# Altium project PCB_Project.PrjPcb
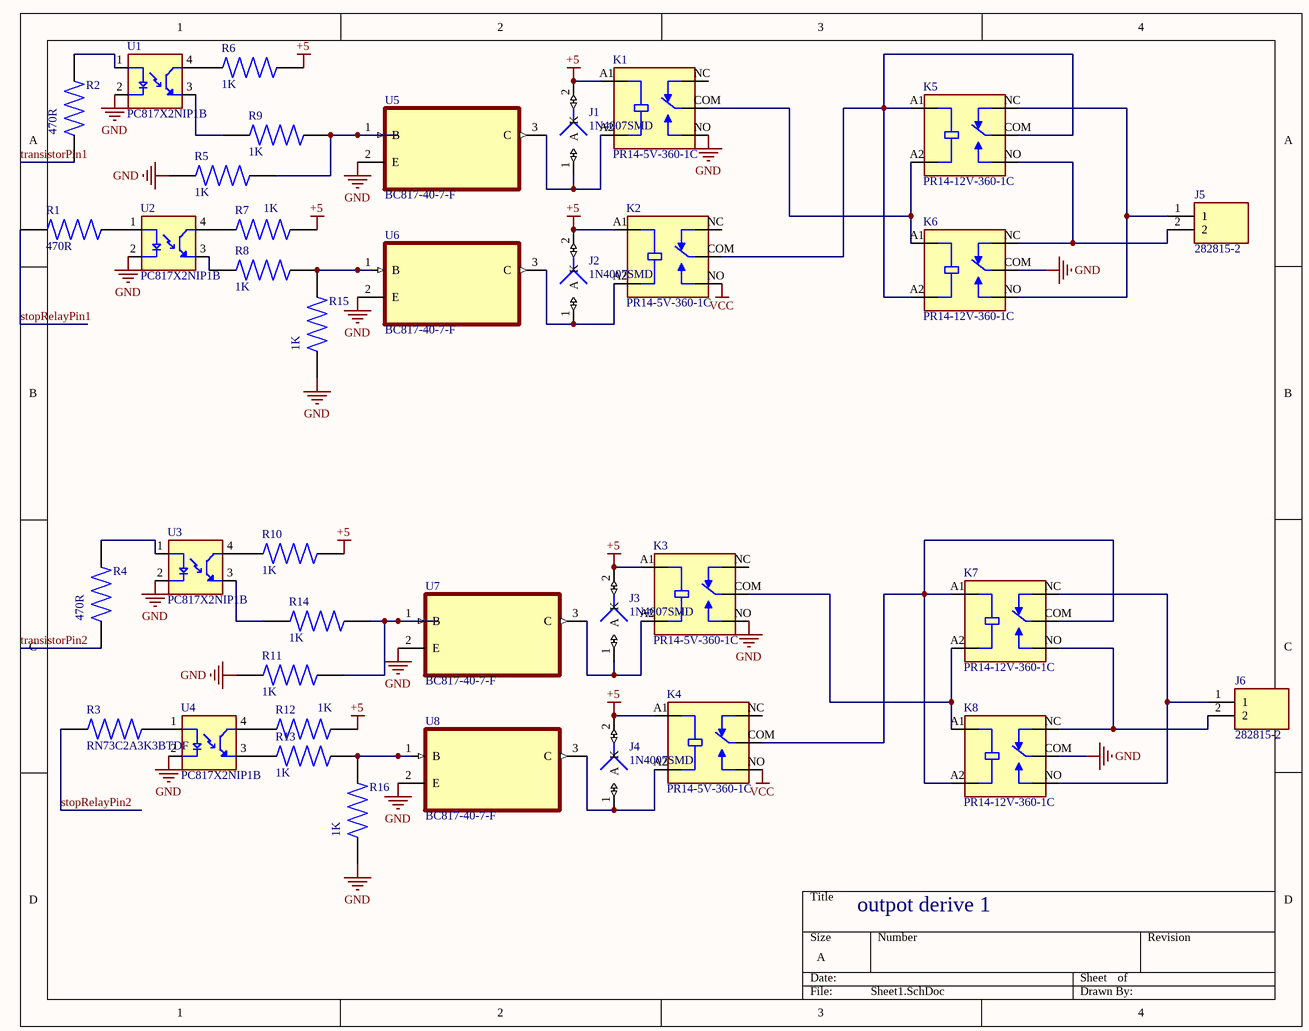
[diagram p0: Sheet1.SchDoc]
7 sheets, 153 parts. Net scope: global (net labels, ports and power ports of the same name join across sheets).
Board file: PCB1.PcbDoc
Sheets:
  Sheet1.SchDoc
  Sheet2.SchDoc
  Sheet3.SchDoc
  Sheet4.SchDoc
  Sheet5.SchDoc
  Sheet6.SchDoc
  Sheet7.SchDoc

## Sheet Sheet1.SchDoc
size A; SheetNumber: 1; SheetTotal: 7

### Parts
J1  1N4007SMD  [C1206]
J2  1N4007SMD  [C1206]
J3  1N4007SMD  [C1206]
J4  1N4007SMD  [C1206]
J5  282815-2  [TE_282815-2]
J6  282815-2  [TE_282815-2]
K1  PR14-5V-360-1C  [RELAY_PR14-5V-360-1C]
K2  PR14-5V-360-1C  [RELAY_PR14-5V-360-1C]
K3  PR14-5V-360-1C  [RELAY_PR14-5V-360-1C]
K4  PR14-5V-360-1C  [RELAY_PR14-5V-360-1C]
K5  PR14-12V-360-1C  [RELAY_PR14-5V-360-1C]
K6  PR14-12V-360-1C  [RELAY_PR14-5V-360-1C]
K7  PR14-12V-360-1C  [RELAY_PR14-5V-360-1C]
K8  PR14-12V-360-1C  [RELAY_PR14-5V-360-1C]
R1  470R  [RESC2012X65N]
R2  470R  [RESC2012X65N]
R3  RN73C2A3K3BTDF  [RESC2012X65N]
R4  470R  [RESC2012X65N]
R5  1K  [RESC2012X65N]
R6  1K  [RESC2012X65N]
R7  1K  [RESC2012X65N]
R8  1K  [RESC2012X65N]
R9  1K  [RESC2012X65N]
R10  1K  [RESC2012X65N]
R11  1K  [RESC2012X65N]
R12  1K  [RESC2012X65N]
R13  1K  [RESC2012X65N]
R14  1K  [RESC2012X65N]
R15  1K  [RESC2012X65N]
R16  1K  [RESC2012X65N]
U1  PC817X2NIP1B  [SOIC254P960X420-4N]
U2  PC817X2NIP1B  [SOIC254P960X420-4N]
U3  PC817X2NIP1B  [SOIC254P960X420-4N]
U4  PC817X2NIP1B  [SOIC254P960X420-4N]
U5  BC817-40-7-F  [SOT103P240X110-3N]
U6  BC817-40-7-F  [SOT103P240X110-3N]
U7  BC817-40-7-F  [SOT103P240X110-3N]
U8  BC817-40-7-F  [SOT103P240X110-3N]

### Nets
+5: J1.2(K) J2.2(K) J3.2(K) J4.2(K) K1.A1(COIL1) K2.A1(COIL1) K3.A1(COIL1) K4.A1(COIL1) R6.2 R7.2 R10.2 R12.2
GND: K1.NO K3.NO K6.COM K8.COM R5.1 R11.1 R15.1 R16.1 U1.2(C) U2.2(C) U3.2(C) U4.2(C) U5.2(E) U6.2(E) U7.2(E) U8.2(E)
VCC: K2.NO K4.NO
stopRelayPin1: R1.1
stopRelayPin2: R3.1
transistorPin1: R2.1
transistorPin2: R4.1
NetJ1_1: J1.1(A) K1.A2(COIL2) U5.3(C)
NetJ2_1: J2.1(A) K2.A2(COIL2) U6.3(C)
NetJ3_1: J3.1(A) K3.A2(COIL2) U7.3(C)
NetJ4_1: J4.1(A) K4.A2(COIL2) U8.3(C)
NetJ5_1: J5.1 K5.NC K6.NO
NetJ5_2: J5.2 K5.NO K6.NC
NetJ6_1: J6.1 K7.NC K8.NO
NetJ6_2: J6.2 K7.NO K8.NC
NetK1_COM: K1.COM K5.A2(COIL2) K6.A1(COIL1)
NetK2_COM: K2.COM K5.A1(COIL1) K5.COM K6.A2(COIL2)
NetK3_COM: K3.COM K7.A2(COIL2) K8.A1(COIL1)
NetK4_COM: K4.COM K7.A1(COIL1) K7.COM K8.A2(COIL2)
NetR1_2: R1.2 U2.1(A)
NetR2_2: R2.2 U1.1(A)
NetR3_2: R3.2 U4.1(A)
NetR4_2: R4.2 U3.1(A)
NetR5_2: R5.2 R9.2 U5.1(B)
NetR6_1: R6.1 U1.4(CT)
NetR7_1: R7.1 U2.4(CT)
NetR8_1: R8.1 U2.3(ET)
NetR8_2: R8.2 R15.2 U6.1(B)
NetR9_1: R9.1 U1.3(ET)
NetR10_1: R10.1 U3.4(CT)
NetR11_2: R11.2 R14.2 U7.1(B)
NetR12_1: R12.1 U4.4(CT)
NetR13_1: R13.1 U4.3(ET)
NetR13_2: R13.2 R16.2 U8.1(B)
NetR14_1: R14.1 U3.3(ET)

Not connected (* = marked no-connect by the designer): K1 NC; K2 NC; K3 NC; K4 NC

### Notes on the sheet
- outpot derive 1

### Library data of the parts
J1-J4 = 1N4007SMD: RECTIFIER, 1KV, 1A, DO-214AC; Available until stocks are exhausted Alternatives available; MF: Multicomp Pro; Availability: Not in stock; Check_prices: https://www.snapeda.com/parts/1N4007SMD/Multicomp/view-part/?ref=eda; Package: None; SnapEDA_Link: https://www.snapeda.com/parts/1N4007SMD/Multicomp/view-part/?ref=snap; MP: 1N4007SMD; Price: None; Value: *
J5 J6 = 282815-2: 2 Position Terminal Block Header, Male Pins, Shrouded (2 Side) 0.200 (5.08mm) 90Â°, Right Angle - Through Hole; MF: TE Connectivity; SnapEDA_Link: https://www.snapeda.com/parts/282815-2/TE+Connectivity+AMP+Connectors/view-part/?ref=snap; Package: None; Value: *; MP: 282815-2; EU_RoHS_Compliance: Compliant with Exemptions; Check_prices: https://www.snapeda.com/parts/282815-2/TE+Connectivity+AMP+Connectors/view-part/?ref=eda
K1-K8 = PR14-5V-360-1C: 19 x 15.5 x 15.8 mm, 5 V, 10 A, SPDT (1 Form C), Power Relay; MF: Same Sky; SnapEDA_Link: https://www.snapeda.com/parts/PR14-5V-360-1C/Same+Sky/view-part/?ref=snap; Package: None; Value: *; MP: PR14-5V-360-1C; Check_prices: https://www.snapeda.com/parts/PR14-5V-360-1C/Same+Sky/view-part/?ref=eda
R1-R16 = RN73C2A3K3BTDF: TE; IND Devices; Resistors; RN 0805 3K3 0.1% 10PPM 1K RL | TE Connectivity RN73C2A3K3BTDF; Power_Rating: .1 W; Resistance: 3.3K; Voltage_Rating: 100 V; Tolerance: .1%; SnapEDA_Link: https://www.snapeda.com/parts/RN73C2A3K3BTDF/TE+Connectivity/view-part/?ref=snap; Package: 0805; Value: *; MF: TE Connectivity; MP: RN73C2A3K3BTDF; EU_RoHS_Compliance: Compliant; Check_prices: https://www.snapeda.com/parts/RN73C2A3K3BTDF/TE+Connectivity/view-part/?ref=eda
U1-U4 = PC817X2NIP1B: Optocoupler DC-IN 1-CH Transistor DC-OUT 4-Pin DIP SMD T/R; MF: Sharp Microelectronics; SnapEDA_Link: https://www.snapeda.com/parts/PC817X2NIP1B/Sharp+Microelectronics/view-part/?ref=snap; Package: SMD-4 Sharp Microelectronics; Value: *; MP: PC817X2NIP1B; Check_prices: https://www.snapeda.com/parts/PC817X2NIP1B/Sharp+Microelectronics/view-part/?ref=eda
U5-U8 = BC817-40-7-F: Bipolar (BJT) Transistor NPN 45 V 500 mA 100MHz 310 mW Surface Mount SOT-23-3; MF: Diodes Inc.; MP: BC817-40-7-F; Price: None; Package: SOT-23 Diodes Inc.; Check_prices: https://www.snapeda.com/parts/BC817-40-7-F/Diodes+Inc./view-part/?ref=eda; Value: *; Availability: In Stock; Purchase-URL: https://pricing.snapeda.com/search/part/BC817-40-7-F/?ref=eda; SnapEDA_Link: https://www.snapeda.com/parts/BC817-40-7-F/Diodes+Inc./view-part/?ref=snap

## Sheet Sheet2.SchDoc
size A; SheetNumber: 2; SheetTotal: 7
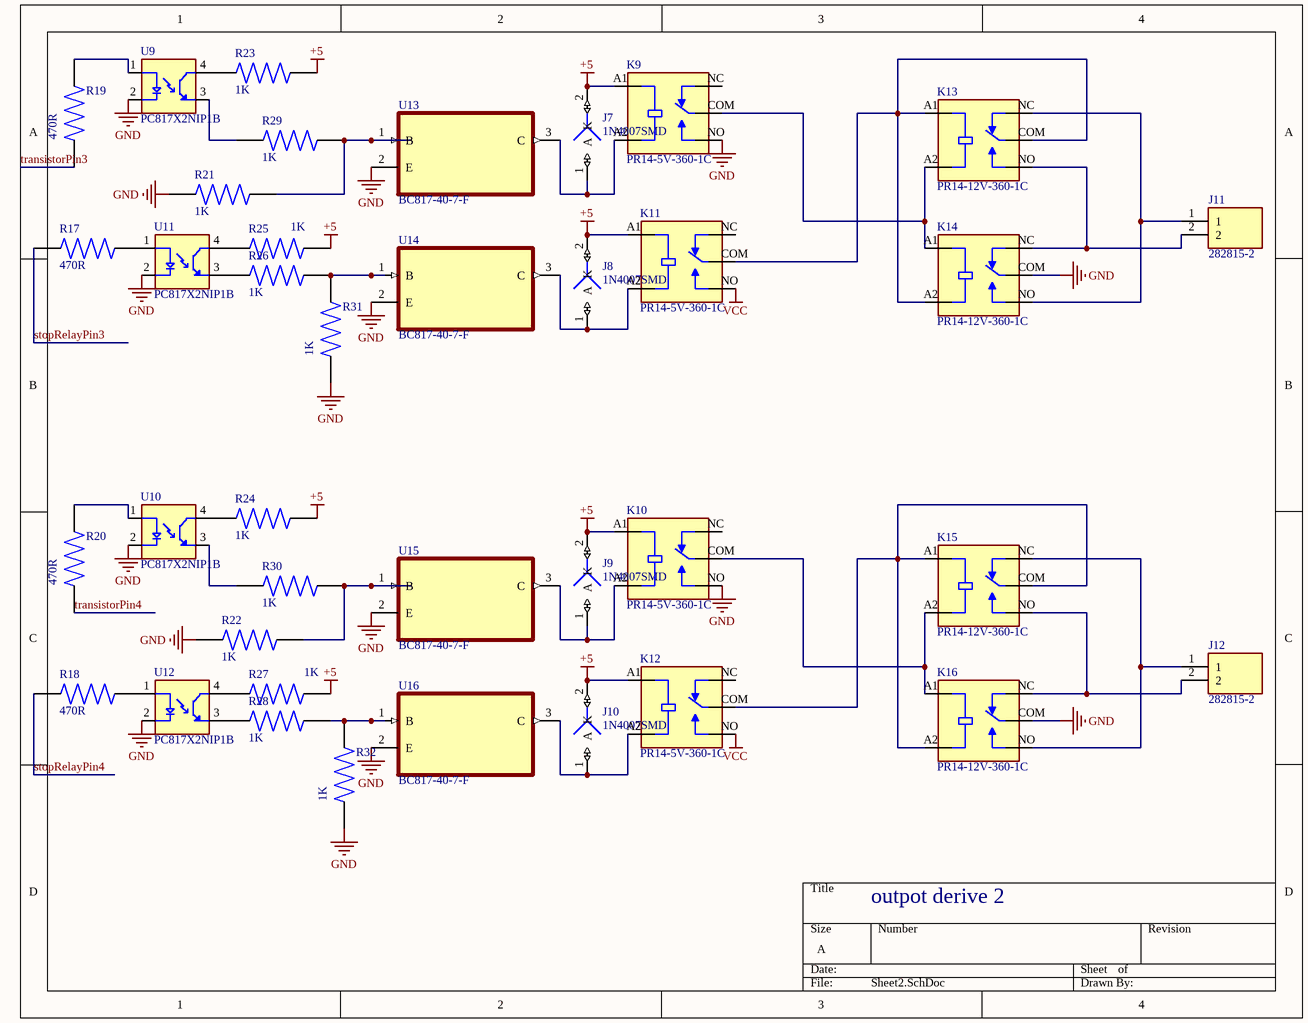
[diagram p1: Sheet2.SchDoc]

### Parts
J7  1N4007SMD  [C1206]
J8  1N4007SMD  [C1206]
J9  1N4007SMD  [C1206]
J10  1N4007SMD  [C1206]
J11  282815-2  [TE_282815-2]
J12  282815-2  [TE_282815-2]
K9  PR14-5V-360-1C  [RELAY_PR14-5V-360-1C]
K10  PR14-5V-360-1C  [RELAY_PR14-5V-360-1C]
K11  PR14-5V-360-1C  [RELAY_PR14-5V-360-1C]
K12  PR14-5V-360-1C  [RELAY_PR14-5V-360-1C]
K13  PR14-12V-360-1C  [RELAY_PR14-5V-360-1C]
K14  PR14-12V-360-1C  [RELAY_PR14-5V-360-1C]
K15  PR14-12V-360-1C  [RELAY_PR14-5V-360-1C]
K16  PR14-12V-360-1C  [RELAY_PR14-5V-360-1C]
R17  470R  [RESC2012X65N]
R18  470R  [RESC2012X65N]
R19  470R  [RESC2012X65N]
R20  470R  [RESC2012X65N]
R21  1K  [RESC2012X65N]
R22  1K  [RESC2012X65N]
R23  1K  [RESC2012X65N]
R24  1K  [RESC2012X65N]
R25  1K  [RESC2012X65N]
R26  1K  [RESC2012X65N]
R27  1K  [RESC2012X65N]
R28  1K  [RESC2012X65N]
R29  1K  [RESC2012X65N]
R30  1K  [RESC2012X65N]
R31  1K  [RESC2012X65N]
R32  1K  [RESC2012X65N]
U9  PC817X2NIP1B  [SOIC254P960X420-4N]
U10  PC817X2NIP1B  [SOIC254P960X420-4N]
U11  PC817X2NIP1B  [SOIC254P960X420-4N]
U12  PC817X2NIP1B  [SOIC254P960X420-4N]
U13  BC817-40-7-F  [SOT103P240X110-3N]
U14  BC817-40-7-F  [SOT103P240X110-3N]
U15  BC817-40-7-F  [SOT103P240X110-3N]
U16  BC817-40-7-F  [SOT103P240X110-3N]

### Nets
+5: J7.2(K) J8.2(K) J9.2(K) J10.2(K) K9.A1(COIL1) K10.A1(COIL1) K11.A1(COIL1) K12.A1(COIL1) R23.2 R24.2 R25.2 R27.2
GND: K9.NO K10.NO K14.COM K16.COM R21.1 R22.1 R31.1 R32.1 U9.2(C) U10.2(C) U11.2(C) U12.2(C) U13.2(E) U14.2(E) U15.2(E) U16.2(E)
VCC: K11.NO K12.NO
stopRelayPin3: R17.1
stopRelayPin4: R18.1
transistorPin3: R19.1
transistorPin4: R20.1
NetJ7_1: J7.1(A) K9.A2(COIL2) U13.3(C)
NetJ8_1: J8.1(A) K11.A2(COIL2) U14.3(C)
NetJ9_1: J9.1(A) K10.A2(COIL2) U15.3(C)
NetJ10_1: J10.1(A) K12.A2(COIL2) U16.3(C)
NetJ11_1: J11.1 K13.NC K14.NO
NetJ11_2: J11.2 K13.NO K14.NC
NetJ12_1: J12.1 K15.NC K16.NO
NetJ12_2: J12.2 K15.NO K16.NC
NetK9_COM: K9.COM K13.A2(COIL2) K14.A1(COIL1)
NetK10_COM: K10.COM K15.A2(COIL2) K16.A1(COIL1)
NetK11_COM: K11.COM K13.A1(COIL1) K13.COM K14.A2(COIL2)
NetK12_COM: K12.COM K15.A1(COIL1) K15.COM K16.A2(COIL2)
NetR17_2: R17.2 U11.1(A)
NetR18_2: R18.2 U12.1(A)
NetR19_2: R19.2 U9.1(A)
NetR20_2: R20.2 U10.1(A)
NetR21_2: R21.2 R29.2 U13.1(B)
NetR22_2: R22.2 R30.2 U15.1(B)
NetR23_1: R23.1 U9.4(CT)
NetR24_1: R24.1 U10.4(CT)
NetR25_1: R25.1 U11.4(CT)
NetR26_1: R26.1 U11.3(ET)
NetR26_2: R26.2 R31.2 U14.1(B)
NetR27_1: R27.1 U12.4(CT)
NetR28_1: R28.1 U12.3(ET)
NetR28_2: R28.2 R32.2 U16.1(B)
NetR29_1: R29.1 U9.3(ET)
NetR30_1: R30.1 U10.3(ET)

Not connected (* = marked no-connect by the designer): K9 NC; K10 NC; K11 NC; K12 NC

### Notes on the sheet
- outpot derive 2

### Library data of the parts
J7-J10 = 1N4007SMD: as J1 on sheet Sheet1; Availability: Not in stock; Check_prices: https://www.snapeda.com/parts/1N4007SMD/Multicomp/view-part/?ref=eda; Package: None; SnapEDA_Link: https://www.snapeda.com/parts/1N4007SMD/Multicomp/view-part/?ref=snap; MP: 1N4007SMD; Price: None; Value: *
J11 J12 = 282815-2: as J5 on sheet Sheet1; SnapEDA_Link: https://www.snapeda.com/parts/282815-2/TE+Connectivity+AMP+Connectors/view-part/?ref=snap; Package: None; Value: *; MP: 282815-2; EU_RoHS_Compliance: Compliant with Exemptions; Check_prices: https://www.snapeda.com/parts/282815-2/TE+Connectivity+AMP+Connectors/view-part/?ref=eda
K9-K16 = PR14-5V-360-1C: as K1 on sheet Sheet1; SnapEDA_Link: https://www.snapeda.com/parts/PR14-5V-360-1C/Same+Sky/view-part/?ref=snap; Package: None; Value: *; MP: PR14-5V-360-1C; Check_prices: https://www.snapeda.com/parts/PR14-5V-360-1C/Same+Sky/view-part/?ref=eda
R17-R32 = RN73C2A3K3BTDF: as R1 on sheet Sheet1; SnapEDA_Link: https://www.snapeda.com/parts/RN73C2A3K3BTDF/TE+Connectivity/view-part/?ref=snap; Package: 0805; Value: *; MF: TE Connectivity; MP: RN73C2A3K3BTDF; EU_RoHS_Compliance: Compliant; Check_prices: https://www.snapeda.com/parts/RN73C2A3K3BTDF/TE+Connectivity/view-part/?ref=eda
U9-U12 = PC817X2NIP1B: as U1 on sheet Sheet1; SnapEDA_Link: https://www.snapeda.com/parts/PC817X2NIP1B/Sharp+Microelectronics/view-part/?ref=snap; Package: SMD-4 Sharp Microelectronics; Value: *; MP: PC817X2NIP1B; Check_prices: https://www.snapeda.com/parts/PC817X2NIP1B/Sharp+Microelectronics/view-part/?ref=eda
U13-U16 = BC817-40-7-F: as U5 on sheet Sheet1; MP: BC817-40-7-F; Price: None; Package: SOT-23 Diodes Inc.; Check_prices: https://www.snapeda.com/parts/BC817-40-7-F/Diodes+Inc./view-part/?ref=eda; Value: *; Availability: In Stock; Purchase-URL: https://pricing.snapeda.com/search/part/BC817-40-7-F/?ref=eda; SnapEDA_Link: https://www.snapeda.com/parts/BC817-40-7-F/Diodes+Inc./view-part/?ref=snap

## Sheet Sheet3.SchDoc
size A; SheetNumber: 3; SheetTotal: 7
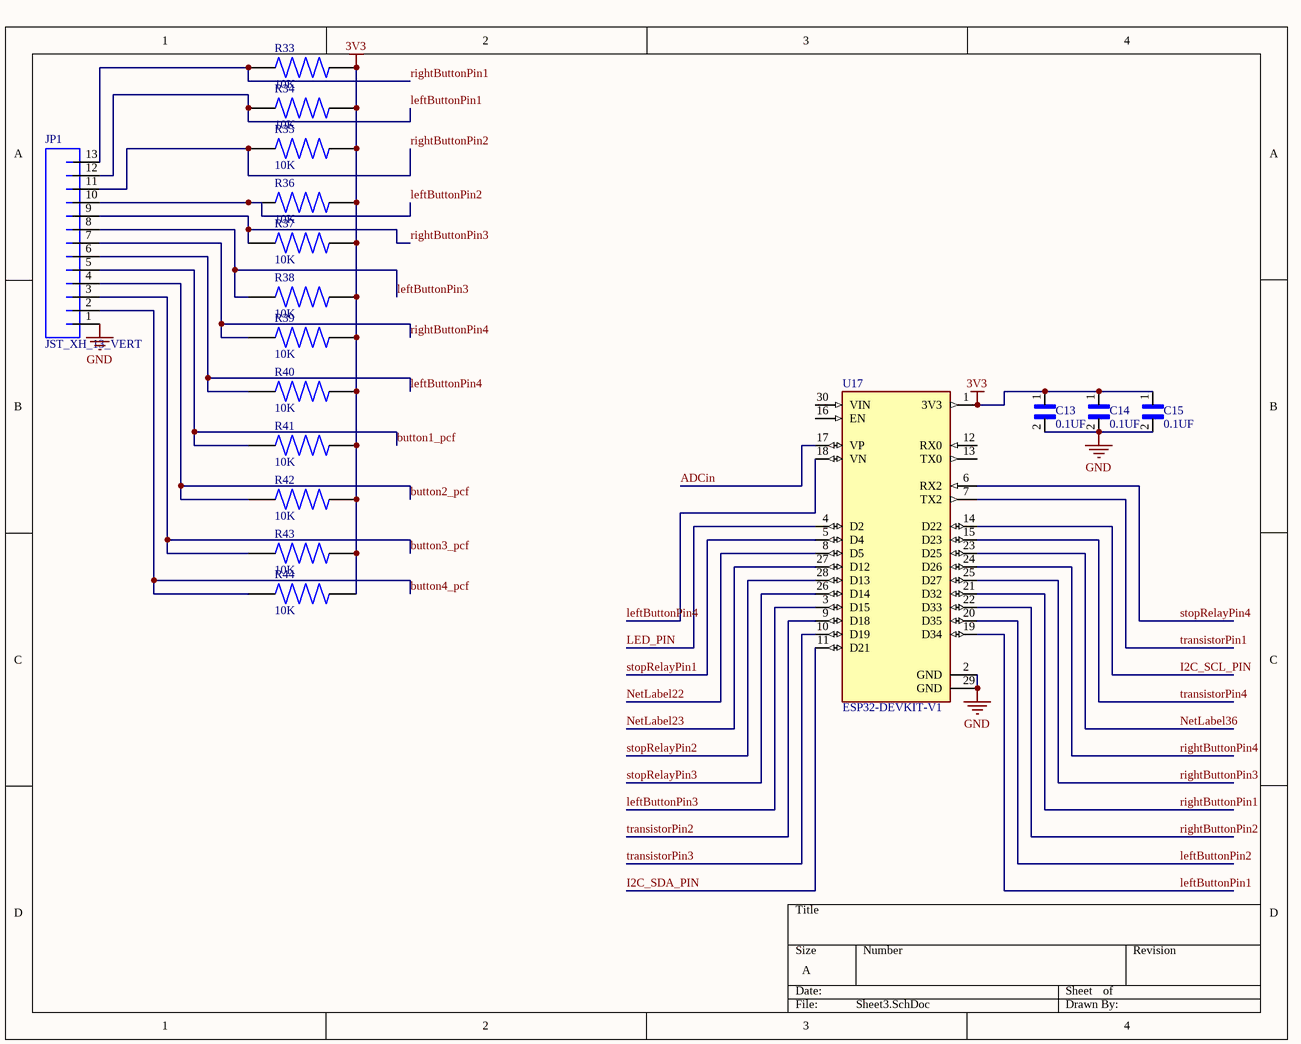
[diagram p2: Sheet3.SchDoc]

### Parts
C13  0.1UF  [CAPC2012X135N]
C14  0.1UF  [CAPC2012X135N]
C15  0.1UF  [CAPC2012X135N]
JP1  JST_XH_13_VERT  [JST-XH-13-PTH-VERT]
R33  10K  [RESC2012X65N]
R34  10K  [RESC2012X65N]
R35  10K  [RESC2012X65N]
R36  10K  [RESC2012X65N]
R37  10K  [RESC2012X65N]
R38  10K  [RESC2012X65N]
R39  10K  [RESC2012X65N]
R40  10K  [RESC2012X65N]
R41  10K  [RESC2012X65N]
R42  10K  [RESC2012X65N]
R43  10K  [RESC2012X65N]
R44  10K  [RESC2012X65N]
U17  ESP32-DEVKIT-V1  [MODULE_ESP32_DEVKIT_V1]

### Nets
3V3: C13.1 C14.1 C15.1 R33.2 R34.2 R35.2 R36.2 R37.2 R38.2 R39.2 R40.2 R41.2 R42.2 R43.2 R44.2 U17.1(3V3)
GND: C13.2 C14.2 C15.2 JP1.1 U17.2(GND) U17.29(GND)
ADCin: U17.17(VP)
button1_pcf: JP1.5 R41.1
button2_pcf: JP1.4 R42.1
button3_pcf: JP1.3 R43.1
button4_pcf: JP1.2 R44.1
I2C_SCL_PIN: U17.14(D22)
I2C_SDA_PIN: U17.11(D21)
LED_PIN: U17.4(D2)
leftButtonPin1: JP1.12 R34.1 U17.19(D34)
leftButtonPin2: JP1.10 R36.1 U17.20(D35)
leftButtonPin3: JP1.8 R38.1 U17.3(D15)
leftButtonPin4: JP1.6 R40.1 U17.18(VN)
NetLabel22: U17.8(D5)
NetLabel23: U17.27(D12)
NetLabel36: U17.23(D25)
rightButtonPin1: JP1.13 R33.1 U17.21(D32)
rightButtonPin2: JP1.11 R35.1 U17.22(D33)
rightButtonPin3: JP1.9 R37.1 U17.25(D27)
rightButtonPin4: JP1.7 R39.1 U17.24(D26)
stopRelayPin1: U17.5(D4)
stopRelayPin2: U17.28(D13)
stopRelayPin3: U17.26(D14)
stopRelayPin4: U17.6(RX2)
transistorPin1: U17.7(TX2)
transistorPin2: U17.9(D18)
transistorPin3: U17.10(D19)
transistorPin4: U17.15(D23)

Not connected (* = marked no-connect by the designer): U17 12(RX0) 13(TX0) 16(EN) 30(VIN)

### Library data of the parts
C13-C15 = GCM2165C2A151JA16D: Cap Ceramic 150pF 100V C0G 5% Pad SMD 0805 125Â°C Automotive T/R; Package: None; Price: None; Value: *; MP: GCM2165C2A151JA16D; Availability: Unavailable
JP1 = JST_XH_13_VERT: Manufacturer: JST Sales America, Inc.; PartNumber: B13B-XH-A(LF)(SN); Mounting Technology: Through Hole; PackageReference: JST-XH
R33-R44 = RN73C2A3K3BTDF: as R1 on sheet Sheet1; SnapEDA_Link: https://www.snapeda.com/parts/RN73C2A3K3BTDF/TE+Connectivity/view-part/?ref=snap; Package: 0805; Value: *; MF: TE Connectivity; MP: RN73C2A3K3BTDF; EU_RoHS_Compliance: Compliant; Check_prices: https://www.snapeda.com/parts/RN73C2A3K3BTDF/TE+Connectivity/view-part/?ref=eda
U17 = ESP32-DEVKIT-V1: Dual core, Wi-Fi: 2.4 GHz up to 150 Mbits/s,BLE (Bluetooth Low Energy) and legacy Bluetooth, 32 bits, Up to 240 MHz; MF: Do it; SnapEDA_Link: https://www.snapeda.com/parts/ESP32-DEVKIT-V1/Do+it/view-part/?ref=snap; Package: None; Value: *; MP: ESP32-DEVKIT-V1; Check_prices: https://www.snapeda.com/parts/ESP32-DEVKIT-V1/Do+it/view-part/?ref=eda

## Sheet Sheet4.SchDoc
size A; SheetNumber: 4; SheetTotal: 7; SPICEModelCacheHPEEUEEV: <root> / <DocumentId>HPEEUEEV</DocumentId> / <CacheFrame Number="0"> / <Model Name="860010274012_560uf" Kind="CKT"> / <Text>******* / .subckt 860010274012_560uF 1 2 / Rser 1 3 0.163 / Lser 2 4 0.000000024 / C1 3 4 0.00056 / Rpar 3 4 178571.428571429 / .ends 860010274012_560uF</Text> / </Model> / <Model Name="860010275016_1mf" Kind="CKT"> / <Text>******* / .subckt 860010275016_1mF 1 2 / Rser 1 3 0.145 / Lser 2 4 0.0000000269 / C1 3 4 0.001 / Rpar 3 4 100000 / .ends 860010275016_1mF</Text> / </Model> / <Model Name="7345_744777001_1u" Kind="CKT"> / <Text>******* / .subckt 7345_744777001_1u 1 2 / Rp 1 2 2428.067211 / Cp 1 2 3.37078710741p / Rs 1 N3 0.0084 / L1 N3 2 0.888631308826u / .ends 7345_744777001_1u</Text> / </Model> / </CacheFrame> / </root>
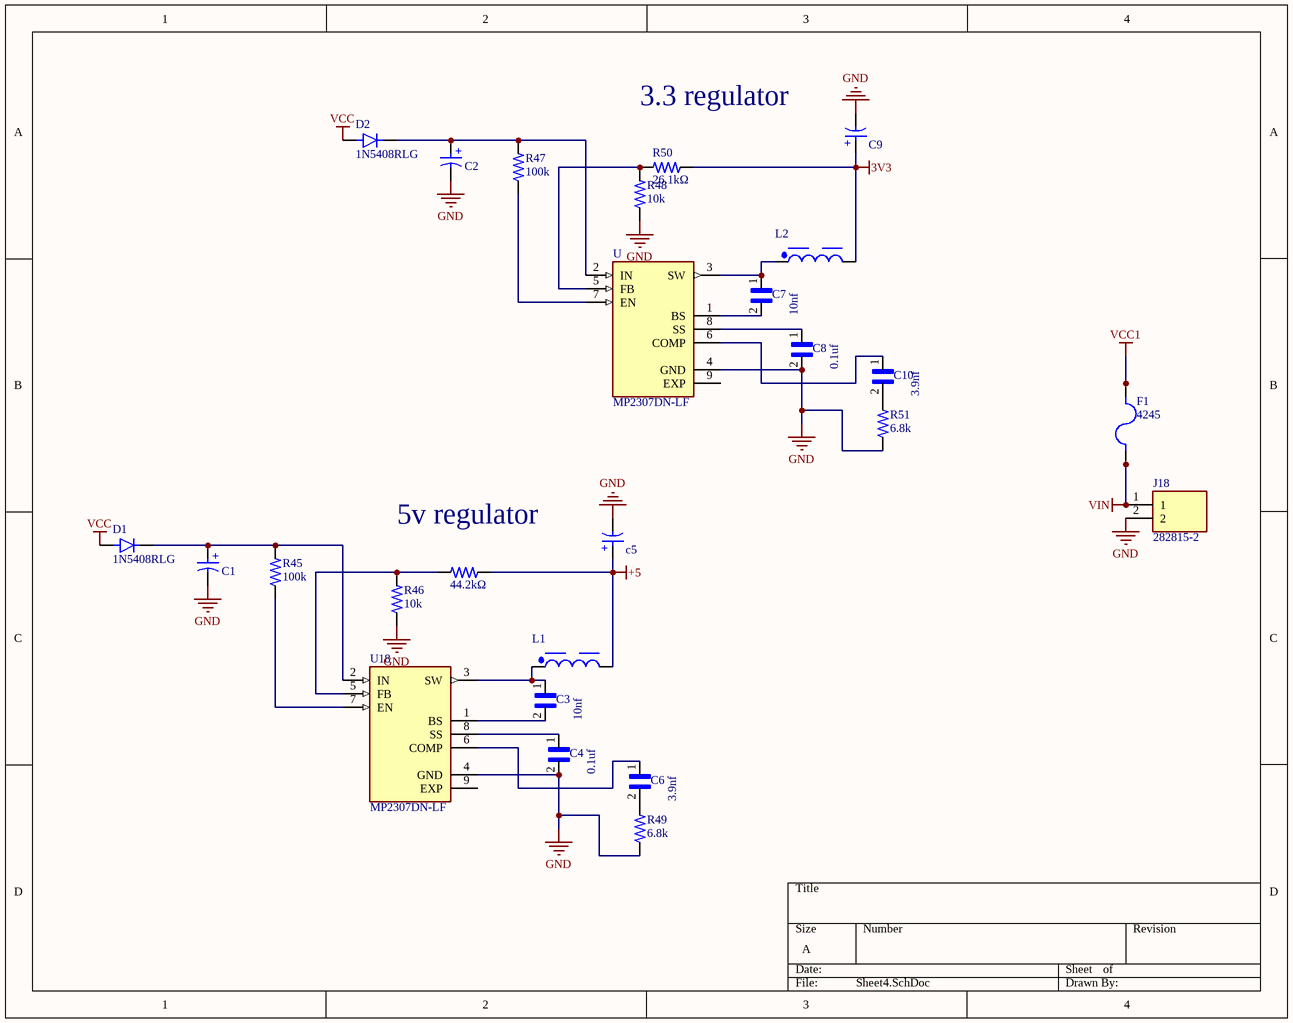
[diagram p3: Sheet4.SchDoc]

### Parts
C1  1000uF  [WCAP-ATG8_D10H12.5]  (value not drawn)
C2  1000uF  [WCAP-ATG8_D10H12.5]  (value not drawn)
C3  10nf  [CAPC2012X135N]
C4  0.1uf  [CAPC2012X135N]
c5  100uf  [WCAP-ATG8_D8H11.5]  (value not drawn)
C6  3.9nf  [CAPC2012X135N]
C7  10nf  [CAPC2012X135N]
C8  0.1uf  [CAPC2012X135N]
C9  100uf  [WCAP-ATG8_D8H11.5]  (value not drawn)
C10  3.9nf  [CAPC2012X135N]
D1  1N5408RLG  [DIOAD1990W125L900D530]
D2  1N5408RLG  [DIOAD1990W125L900D530]
F1  4245  [FUSE_4245]
J18  282815-2  [TE_282815-2]
L1  1 μH, 6.84 A  [WE-PD_7345]  (value not drawn)
L2  1 μH, 6.84 A  [WE-PD_7345]  (value not drawn)
R45  100k  [RESC2012X65N]
R46  10k  [RESC2012X65N]
R47  100k  [RESC2012X65N]
R48  10k  [RESC2012X65N]
R49  6.8k  [RESC2012X65N]
R50  26.1kΩ  [RESC2012X65N]
R51  6.8k  [RESC2012X65N]
U  MP2307DN-LF  [SOIC127P600X170-9N]
U18  MP2307DN-LF  [SOIC127P600X170-9N]
  44.2kΩ  [RESC2012X65N]

### Nets
3V3: C9.1(P) L2.2 R50.1
+5: c5.1(P) L1.2 .1
GND: C1.2(N) C2.2(N) C4.2 c5.2(N) C8.2 C9.2(N) J18.2 R46.1 R48.1 R49.1 R51.1 U.4(GND) U18.4(GND)
VCC: D1.A D2.A
VCC1: F1.2_1 F1.2_2
VIN: F1.1_1 F1.1_2 J18.1
NetC1_1: C1.1(P) D1.C(K) R45.2 U18.2(IN)
NetC2_1: C2.1(P) D2.C(K) R47.2 U.2(IN)
NetC3_1: C3.1 L1.1 U18.3(SW)
NetC3_2: C3.2 U18.1(BS)
NetC4_1: C4.1 U18.8(SS)
NetC6_1: C6.1 U18.6(COMP)
NetC6_2: C6.2 R49.2
NetC7_1: C7.1 L2.1 U.3(SW)
NetC7_2: C7.2 U.1(BS)
NetC8_1: C8.1 U.8(SS)
NetC10_1: C10.1 U.6(COMP)
NetC10_2: C10.2 R51.2
NetR45_1: R45.1 U18.7(EN)
NetR46_2: R46.2 U18.5(FB) .2
NetR47_1: R47.1 U.7(EN)
NetR48_2: R48.2 R50.2 U.5(FB)

Not connected (* = marked no-connect by the designer): U 9(EXP); U18 9(EXP)

### Notes on the sheet
- (near C9) 3.3 regulator
- 5v regulator
- (in symbol 860010274012) +
- (in symbol 860010275016) +

### Library data of the parts
C1 C2 = 860010275016: WCAP-ATG8 Aluminum Electrolytic Capacitor, Radial, THT, D10 x H12.5mm, 1000uF, 10V; Manufacturer: Wurth Elektronik; Capacitance Tolerance: +/-20%; Dissipation Factor: 19%; Endurance: 2000h; Leakage Current: 100uA; Ripple Current: 726mA; Technical Reference: ATBF125102M010DSPA9B000; Manufacturer Part Number: 860010275016; Category: Aluminum Electrolytic Capacitors; Match Code: WCAP-ATG8; ComponentLink1Description: Website Link; ComponentLink1URL: https://www.we-online.com/redexpert/article/860010275016?ad; ComponentLink2Description: Datasheet Link; ComponentLink2URL: https://www.we-online.com/redexpert/spec/860010275016?ad; Mount: Through Hole; Operating Temperature Max: 85°C; Operating Temperature Min: -40°C; Packaging: Ammo Pack; Height: 12.5mm; Diameter: 10mm; Capacitance: 1000uF; Rated Voltage (DC): 10V
C3 C4 C6-C8 C10 = GCM2165C2A151JA16D: as C13 on sheet Sheet3; Package: None; Price: None; Value: *; MP: GCM2165C2A151JA16D; Availability: Unavailable
c5 C9 = 860010274012: WCAP-ATG8 Aluminum Electrolytic Capacitor, Radial, THT, D8 x H11.5mm, 560uF, 10V; Manufacturer: Wurth Elektronik; Capacitance Tolerance: +/-20%; Dissipation Factor: 19%; Endurance: 2000h; Leakage Current: 56uA; Ripple Current: 506mA; Technical Reference: ATBE115561M010DSPA7B000; Manufacturer Part Number: 860010274012; Category: Aluminum Electrolytic Capacitors; Match Code: WCAP-ATG8; ComponentLink1Description: Website Link; ComponentLink1URL: https://www.we-online.com/redexpert/article/860010274012?ad; ComponentLink2Description: Datasheet Link; ComponentLink2URL: https://www.we-online.com/redexpert/spec/860010274012?ad; Mount: Through Hole; Operating Temperature Max: 85°C; Operating Temperature Min: -40°C; Packaging: Ammo Pack; Height: 11.5mm; Diameter: 8mm; Capacitance: 560uF; Rated Voltage (DC): 10V
D1 D2 = 1N5408RLG: Diodo estÃ¡ndar 1000 V 3 A orificio pasante DO-201AD; MF: ON Semiconductor; SnapEDA_Link: https://www.snapeda.com/parts/1N5408RLG/Onsemi/view-part/?ref=snap; Package: AXIAL LEAD-2 ON Semiconductor; Value: *; MP: 1N5408RLG; Check_prices: https://www.snapeda.com/parts/1N5408RLG/Onsemi/view-part/?ref=eda
F1 = 4245: Fuse Holder, THM, Press-Fit, 1 Fuse, Fuse Size 3AG, 15 A, PBT/Brass-Tin | Keystone Electronics 4245; SnapEDA_Link: https://www.snapeda.com/parts/4245/Keystone/view-part/?ref=snap; Package: None; Value: *; MF: Keystone Electronics; MP: 4245; Check_prices: https://www.snapeda.com/parts/4245/Keystone/view-part/?ref=eda
J18 = 282815-2: as J5 on sheet Sheet1; SnapEDA_Link: https://www.snapeda.com/parts/282815-2/TE+Connectivity+AMP+Connectors/view-part/?ref=snap; Package: None; Value: *; MP: 282815-2; EU_RoHS_Compliance: Compliant with Exemptions; Check_prices: https://www.snapeda.com/parts/282815-2/TE+Connectivity+AMP+Connectors/view-part/?ref=eda
L1 L2 = 744777001: WE-PD SMT Power Inductor, size 7345, 1 μH, 6.84 A, 10 mΩ; Manufacturer: Wurth Elektronik; Case/Size Code: 7345; DC Resistance: 8.4 mΩ; DC Resistance Max: 10 mΩ; Inductance: 1 μH; Rated Current: 6.84 A; Saturation Current: 10.2 A; Self Resonant Frequency: 100 MHz; Type: Standard; Manufacturer Part Number: 744777001; Category: Power Inductors; Match Code: WE-PD; ComponentLink1Description: Website Link; ComponentLink1URL: https://www.we-online.com/redexpert/article/744777001?ad; ComponentLink2Description: Datasheet Link; ComponentLink2URL: https://www.we-online.com/redexpert/spec/744777001?ad; Mount: Surface Mount; Min Operating Temperature: -40 °C; Max Operating Temperature: 125 °C; Packaging: Tape and Reel; Length: 7.3 mm; Width: 7.3 mm; Height: 4.5 mm
R45-R51  = CRG0805F33R: Fixed Resistors; MF: TE Connectivity
U U18 = MP2307DN-LF: Buck Switching Regulator IC Positive Adjustable 0.925V 1 Output 3A 8-SOIC _0.154, 3.90mm Width_ Exposed Pad; MF: Monolithic Power; Availability: Unavailable; Price: None; Package: SOIC-8 Monolithic Power Systems; MP: MP2307DN-LF; Value: *; SnapEDA_Link: https://www.snapeda.com/parts/MP2307DN-LF/Monolithic%20Power%20Systems%20Inc./view-part/424671/?ref=snap

## Sheet Sheet5.SchDoc
size A; SheetNumber: 5; SheetTotal: 7
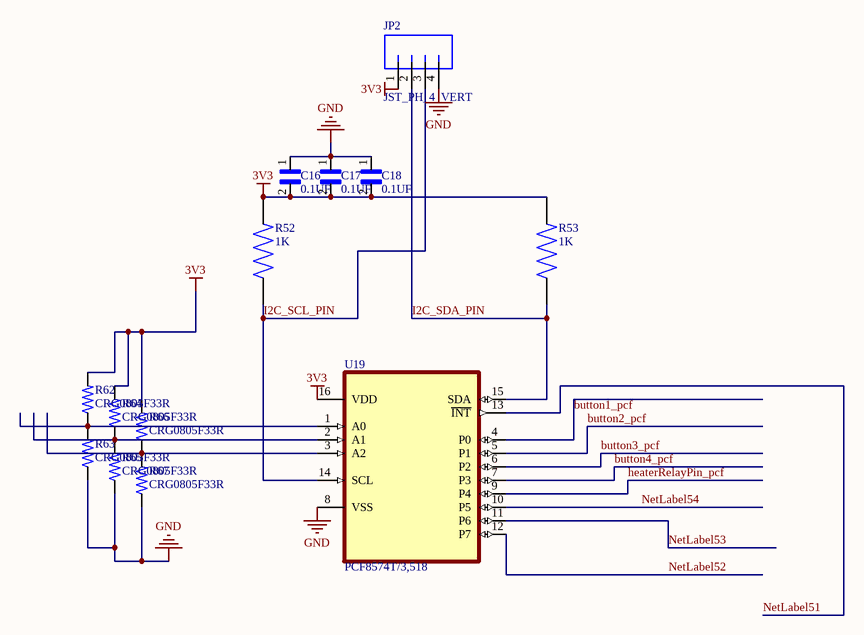
[diagram p4: Sheet5.SchDoc]

### Parts
C16  0.1UF  [CAPC2012X135N]
C17  0.1UF  [CAPC2012X135N]
C18  0.1UF  [CAPC2012X135N]
JP2  JST_PH_4_VERT  [JST-PH-4-PTH-VERT]
R52  1K  [RESC2012X65N]
R53  1K  [RESC2012X65N]
R62  CRG0805F33R  [RESC2012X65N]
R63  CRG0805F33R  [RESC2012X65N]
R64  CRG0805F33R  [RESC2012X65N]
R65  CRG0805F33R  [RESC2012X65N]
R66  CRG0805F33R  [RESC2012X65N]
R67  CRG0805F33R  [RESC2012X65N]
U19  PCF8574T/3,518  [SOIC127P1032X265-16N]

### Nets
3V3: C16.2 C17.2 C18.2 JP2.1 R52.2 R53.2 R62.2 R64.2 R66.2 U19.16(VDD)
GND: C16.1 C17.1 C18.1 JP2.4 R63.1 R65.1 R67.1 U19.8(VSS)
button1_pcf: U19.4(P0)
button2_pcf: U19.5(P1)
button3_pcf: U19.6(P2)
button4_pcf: U19.7(P3)
heaterRelayPin_pcf: U19.9(P4)
I2C_SCL_PIN: JP2.3 R52.1 U19.14(SCL)
I2C_SDA_PIN: JP2.2 R53.1 U19.15(SDA)
NetLabel51: U19.13(~{INT})
NetLabel52: U19.12(P7)
NetLabel53: U19.11(P6)
NetLabel54: U19.10(P5)
NetR62_1: R62.1 R63.2 U19.1(A0)
NetR64_1: R64.1 R65.2 U19.2(A1)
NetR66_1: R66.1 R67.2 U19.3(A2)

### Library data of the parts
C16-C18 = GCM2165C2A151JA16D: as C13 on sheet Sheet3; Package: None; Price: None; Value: *; MP: GCM2165C2A151JA16D; Availability: Unavailable
JP2 = JST_PH_4_VERT: PartNumber: B4B-PH-K-S(LF)(SN); Manufacturer: JST Sales America Inc.; PackageReference: JST-PH; Mounting Technology: Through Hole
R52 R53 = RN73C2A3K3BTDF: as R1 on sheet Sheet1; SnapEDA_Link: https://www.snapeda.com/parts/RN73C2A3K3BTDF/TE+Connectivity/view-part/?ref=snap; Package: 0805; Value: *; MF: TE Connectivity; MP: RN73C2A3K3BTDF; EU_RoHS_Compliance: Compliant; Check_prices: https://www.snapeda.com/parts/RN73C2A3K3BTDF/TE+Connectivity/view-part/?ref=eda
R62-R67 = CRG0805F33R: Fixed Resistors; MF: TE Connectivity; Price: None; MP: CRG0805F33R; Package: 0805; Value: *; Purchase-URL: https://pricing.snapeda.com/search/part/CRG0805F33R/?ref=eda; Check_prices: https://www.snapeda.com/parts/CRG0805F33R/TE+Connectivity+Passive+Product/view-part/?ref=eda; Availability: In Stock; EU_RoHS_Compliance: Compliant with Exemptions; SnapEDA_Link: https://www.snapeda.com/parts/CRG0805F33R/TE+Connectivity+Passive+Product/view-part/?ref=snap
U19 = PCF8574T/3,518: I/O Expander 8 IÂ²C 100 kHz 16-SO; MF: NXP USA; Package: SOIC-16 NXP Semiconductors; Check_prices: https://www.snapeda.com/parts/PCF8574T/3,518/NXP+USA+Inc./view-part/?ref=eda; Value: *; Purchase-URL: https://pricing.snapeda.com/search/part/PCF8574T/3,518/?ref=eda; Availability: In Stock; SnapEDA_Link: https://www.snapeda.com/parts/PCF8574T/3,518/NXP+USA+Inc./view-part/?ref=snap; MP: PCF8574T/3,518; Price: None

## Sheet Sheet6.SchDoc
size A; SheetNumber: 6; SheetTotal: 7
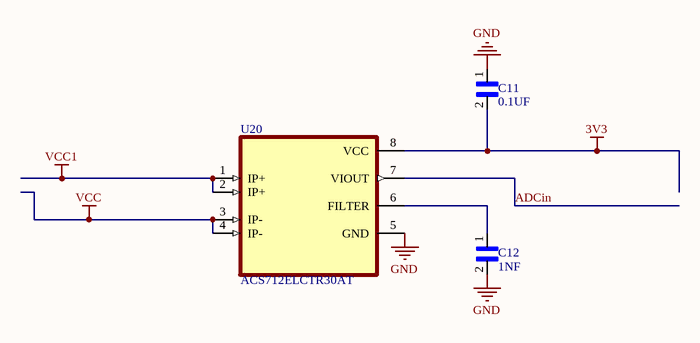
[diagram p5: Sheet6.SchDoc]

### Parts
C11  0.1UF  [CAPC2012X135N]
C12  1NF  [CAPC2012X135N]
U20  ACS712ELCTR30AT  [SOIC127P600X175-8N]

### Nets
3V3: C11.2 U20.8(VCC)
GND: C11.1 C12.2 U20.5(GND)
VCC: U20.3(IP-) U20.4(IP-)
VCC1: U20.1(IP+) U20.2(IP+)
ADCin: U20.7(VIOUT)
NetC12_1: C12.1 U20.6(FILTER)

### Library data of the parts
C11 C12 = GCM2165C2A151JA16D: as C13 on sheet Sheet3; Package: None; Price: None; Value: *; MP: GCM2165C2A151JA16D; Availability: Unavailable
U20 = ACS712ELCTR30AT: Current Sensor 30A 1 Channel Hall Effect, Open Loop Bidirectional 8-SOIC (0.154, 3.90mm Width); MF: Allegro MicroSystems LLC; SnapEDA_Link: https://www.snapeda.com/parts/ACS712ELCTR30AT/Allegro/view-part/?ref=snap; Package: SOIC-8 Allegro; Value: *; MP: ACS712ELCTR30AT; Check_prices: https://www.snapeda.com/parts/ACS712ELCTR30AT/Allegro/view-part/?ref=eda

## Sheet Sheet7.SchDoc
size A; SheetNumber: 7; SheetTotal: 7
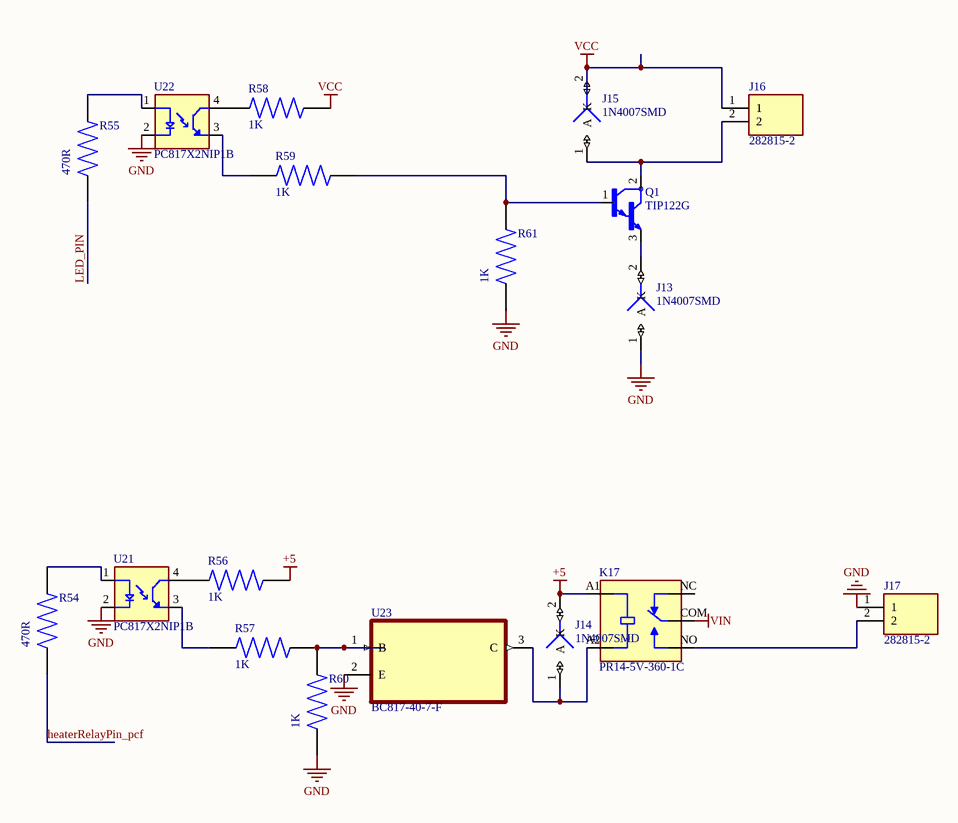
[diagram p6: Sheet7.SchDoc]

### Parts
J13  1N4007SMD  [C1206]
J14  1N4007SMD  [C1206]
J15  1N4007SMD  [C1206]
J16  282815-2  [TE_282815-2]
J17  282815-2  [TE_282815-2]
K17  PR14-5V-360-1C  [RELAY_PR14-5V-360-1C]
Q1  TIP122G  [TO254P1009X445X1985-3]
R54  470R  [RESC2012X65N]
R55  470R  [RESC2012X65N]
R56  1K  [RESC2012X65N]
R57  1K  [RESC2012X65N]
R58  1K  [RESC2012X65N]
R59  1K  [RESC2012X65N]
R60  1K  [RESC2012X65N]
R61  1K  [RESC2012X65N]
U21  PC817X2NIP1B  [SOIC254P960X420-4N]
U22  PC817X2NIP1B  [SOIC254P960X420-4N]
U23  BC817-40-7-F  [SOT103P240X110-3N]

### Nets
+5: J14.2(K) K17.A1(COIL1) R56.2
GND: J13.1(A) J17.1 R60.1 R61.1 U21.2(C) U22.2(C) U23.2(E)
VCC: J15.2(K) J16.1 R58.2
VIN: K17.COM
heaterRelayPin_pcf: R54.1
LED_PIN: R55.1
NetJ13_2: J13.2(K) Q1.3(E)
NetJ14_1: J14.1(A) K17.A2(COIL2) U23.3(C)
NetJ15_1: J15.1(A) J16.2 Q1.2(C)
NetJ17_2: J17.2 K17.NO
NetQ1_1: Q1.1(B) R59.2 R61.2
NetR54_2: R54.2 U21.1(A)
NetR55_2: R55.2 U22.1(A)
NetR56_1: R56.1 U21.4(CT)
NetR57_1: R57.1 U21.3(ET)
NetR57_2: R57.2 R60.2 U23.1(B)
NetR58_1: R58.1 U22.4(CT)
NetR59_1: R59.1 U22.3(ET)

Not connected (* = marked no-connect by the designer): K17 NC

### Library data of the parts
J13-J15 = 1N4007SMD: as J1 on sheet Sheet1; Availability: Not in stock; Check_prices: https://www.snapeda.com/parts/1N4007SMD/Multicomp/view-part/?ref=eda; Package: None; SnapEDA_Link: https://www.snapeda.com/parts/1N4007SMD/Multicomp/view-part/?ref=snap; MP: 1N4007SMD; Price: None; Value: *
J16 J17 = 282815-2: as J5 on sheet Sheet1; SnapEDA_Link: https://www.snapeda.com/parts/282815-2/TE+Connectivity+AMP+Connectors/view-part/?ref=snap; Package: None; Value: *; MP: 282815-2; EU_RoHS_Compliance: Compliant with Exemptions; Check_prices: https://www.snapeda.com/parts/282815-2/TE+Connectivity+AMP+Connectors/view-part/?ref=eda
K17 = PR14-5V-360-1C: as K1 on sheet Sheet1; SnapEDA_Link: https://www.snapeda.com/parts/PR14-5V-360-1C/Same+Sky/view-part/?ref=snap; Package: None; Value: *; MP: PR14-5V-360-1C; Check_prices: https://www.snapeda.com/parts/PR14-5V-360-1C/Same+Sky/view-part/?ref=eda
Q1 = TIP122G: Bipolar (BJT) Transistor NPN - Darlington 100V 5A 2W Through Hole TO-220AB; MF: ON Semiconductor; Check_prices: https://www.snapeda.com/parts/TIP122G/ON%20Semiconductor/view-part/385313/?ref=eda; Price: None; SnapEDA_Link: https://www.snapeda.com/parts/TIP122G/ON%20Semiconductor/view-part/385313/?ref=snap; Package: None; Purchase-URL: https://pricing.snapeda.com/search/part/TIP122G/?ref=eda; Availability: Good; Value: *; MP: TIP122G
R54-R61 = RN73C2A3K3BTDF: as R1 on sheet Sheet1; SnapEDA_Link: https://www.snapeda.com/parts/RN73C2A3K3BTDF/TE+Connectivity/view-part/?ref=snap; Package: 0805; Value: *; MF: TE Connectivity; MP: RN73C2A3K3BTDF; EU_RoHS_Compliance: Compliant; Check_prices: https://www.snapeda.com/parts/RN73C2A3K3BTDF/TE+Connectivity/view-part/?ref=eda
U21 U22 = PC817X2NIP1B: as U1 on sheet Sheet1; SnapEDA_Link: https://www.snapeda.com/parts/PC817X2NIP1B/Sharp+Microelectronics/view-part/?ref=snap; Package: SMD-4 Sharp Microelectronics; Value: *; MP: PC817X2NIP1B; Check_prices: https://www.snapeda.com/parts/PC817X2NIP1B/Sharp+Microelectronics/view-part/?ref=eda
U23 = BC817-40-7-F: as U5 on sheet Sheet1; MP: BC817-40-7-F; Price: None; Package: SOT-23 Diodes Inc.; Check_prices: https://www.snapeda.com/parts/BC817-40-7-F/Diodes+Inc./view-part/?ref=eda; Value: *; Availability: In Stock; Purchase-URL: https://pricing.snapeda.com/search/part/BC817-40-7-F/?ref=eda; SnapEDA_Link: https://www.snapeda.com/parts/BC817-40-7-F/Diodes+Inc./view-part/?ref=snap

## Nets that join several sheets
3V3: Sheet3 (16 pins), Sheet4 (C9.1 L2.2 R50.1), Sheet5 (10 pins), Sheet6 (C11.2 U20.8)
+5: Sheet1 (12 pins), Sheet2 (12 pins), Sheet4 (c5.1 L1.2 .1), Sheet7 (J14.2 K17.A1 R56.2)
GND: Sheet1 (16 pins), Sheet2 (16 pins), Sheet3 (6 pins), Sheet4 (13 pins), Sheet5 (8 pins), Sheet6 (C11.1 C12.2 U20.5), Sheet7 (7 pins)
VCC: Sheet1 (K2.NO K4.NO), Sheet2 (K11.NO K12.NO), Sheet4 (D1.A D2.A), Sheet6 (U20.3 U20.4), Sheet7 (J15.2 J16.1 R58.2)
VCC1: Sheet4 (F1.2_1 F1.2_2), Sheet6 (U20.1 U20.2)
VIN: Sheet4 (F1.1_1 F1.1_2 J18.1), Sheet7 (K17.COM)
ADCin: Sheet3 (U17.17), Sheet6 (U20.7)
button1_pcf: Sheet3 (JP1.5 R41.1), Sheet5 (U19.4)
button2_pcf: Sheet3 (JP1.4 R42.1), Sheet5 (U19.5)
button3_pcf: Sheet3 (JP1.3 R43.1), Sheet5 (U19.6)
button4_pcf: Sheet3 (JP1.2 R44.1), Sheet5 (U19.7)
heaterRelayPin_pcf: Sheet5 (U19.9), Sheet7 (R54.1)
I2C_SCL_PIN: Sheet3 (U17.14), Sheet5 (JP2.3 R52.1 U19.14)
I2C_SDA_PIN: Sheet3 (U17.11), Sheet5 (JP2.2 R53.1 U19.15)
LED_PIN: Sheet3 (U17.4), Sheet7 (R55.1)
stopRelayPin1: Sheet1 (R1.1), Sheet3 (U17.5)
stopRelayPin2: Sheet1 (R3.1), Sheet3 (U17.28)
stopRelayPin3: Sheet2 (R17.1), Sheet3 (U17.26)
stopRelayPin4: Sheet2 (R18.1), Sheet3 (U17.6)
transistorPin1: Sheet1 (R2.1), Sheet3 (U17.7)
transistorPin2: Sheet1 (R4.1), Sheet3 (U17.9)
transistorPin3: Sheet2 (R19.1), Sheet3 (U17.10)
transistorPin4: Sheet2 (R20.1), Sheet3 (U17.15)